# Altium schematic sheet 01_POWER_IO.SchDoc
size 457 x 281 mm; SheetNumber: 1; SheetTotal: 2
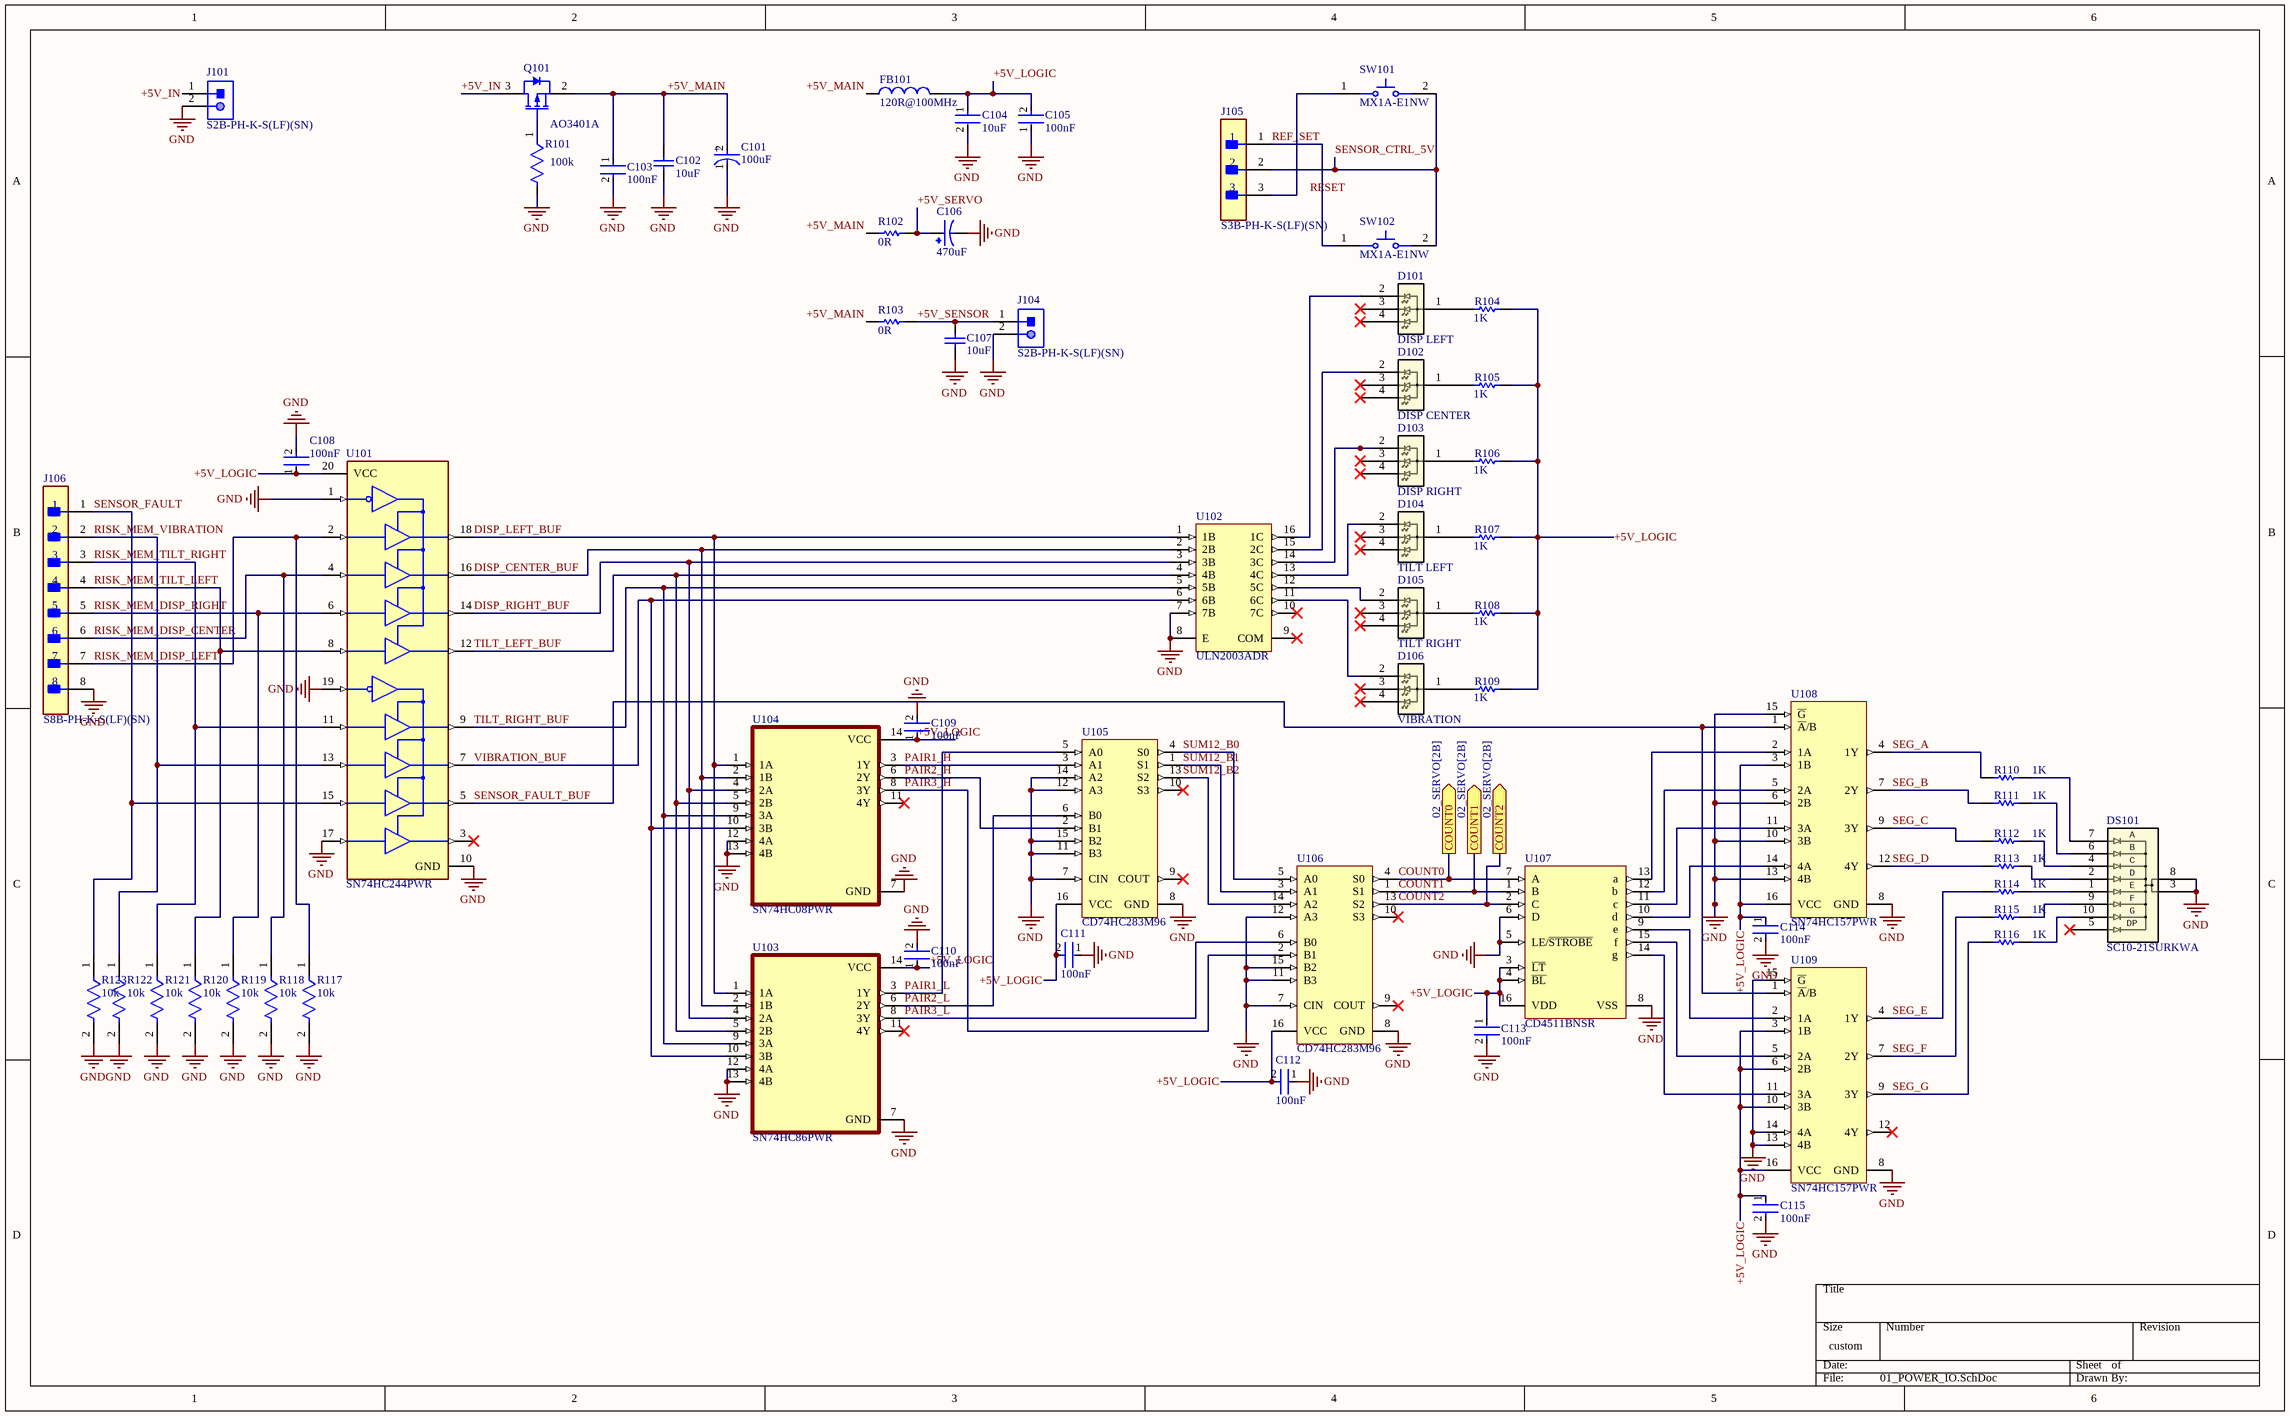
[diagram p0: 01_POWER_IO.SchDoc]

## Parts
C101  100uF  [FP-RAD-TH-D_6_3_0_5-L_11-MFG]
C102  10uF  [CAPC2013X140X45ML15T25]
C103  100nF  [FP-C1608-080-0_1-IPC_B]
C104  10uF  [FP-C2012-125-0_2-MFG]
C105  100nF  [FP-C1608-080-0_1-IPC_B]
C106  470uF  [CAPPRD500W60D1000H1250]
C107  10uF  [CAPC2013X140X45ML15T25]
C108  100nF  [FP-C1608-080-0_1-IPC_B]
C109  100nF  [FP-C1608-080-0_1-IPC_B]
C110  100nF  [FP-C1608-080-0_1-IPC_B]
C111  100nF  [FP-C1608-080-0_1-IPC_B]
C112  100nF  [FP-C1608-080-0_1-IPC_B]
C113  100nF  [FP-C1608-080-0_1-IPC_B]
C114  100nF  [FP-C1608-080-0_1-IPC_B]
C115  100nF  [FP-C1608-080-0_1-IPC_B]
D101  DISP LEFT  [848_ADA]
D102  DISP CENTER  [848_ADA]
D103  DISP RIGHT  [848_ADA]
D104  TILT LEFT  [848_ADA]
D105  TILT RIGHT  [848_ADA]
D106  VIBRATION  [848_ADA]
DS101  SC10-21SURKWA  [SC10-21SURKWA]  (mechanical)
FB101  120R@100MHz  [WE-CBF_0805_L2W1.2H0.9_HC]
J101  S2B-PH-K-S(LF)(SN)  [JST-S2B-PH-K-S_V]
J104  S2B-PH-K-S(LF)(SN)  [JST-S2B-PH-K-S_V]
J105  S3B-PH-K-S(LF)(SN)  [FP-S3B-PH-K-S_LF_SN-MFG]
J106  S8B-PH-K-S(LF)(SN)  [FP-S8B-PH-K-S_LF_SN-MFG]
Q101  AO3401A  [AO-SOT-23-3L_V]
R101  100k  [FP-RC0603-0_55-MFG]
R102  0R  [RESC2013X70X40NL20T20]
R103  0R  [RESC2013X70X40NL20T20]
R104  1K  [RESC1608X55X25NL10T15]
R105  1K  [RESC1608X55X25NL10T15]
R106  1K  [RESC1608X55X25NL10T15]
R107  1K  [RESC1608X55X25NL10T15]
R108  1K  [RESC1608X55X25NL10T15]
R109  1K  [RESC1608X55X25NL10T15]
R110  1K  [RESC1608X55X25NL10T15]
R111  1K  [RESC1608X55X25NL10T15]
R112  1K  [RESC1608X55X25NL10T15]
R113  1K  [RESC1608X55X25NL10T15]
R114  1K  [RESC1608X55X25NL10T15]
R115  1K  [RESC1608X55X25NL10T15]
R116  1K  [RESC1608X55X25NL10T15]
R117  10k  [FP-RC0603-0_55-IPC_C]
R118  10k  [FP-RC0603-0_55-IPC_C]
R119  10k  [FP-RC0603-0_55-IPC_C]
R120  10k  [FP-RC0603-0_55-IPC_C]
R121  10k  [FP-RC0603-0_55-IPC_C]
R122  10k  [FP-RC0603-0_55-IPC_C]
R123  10k  [FP-RC0603-0_55-IPC_C]
SW101  MX1A-E1NW  [MX1A-E1NW]
SW102  MX1A-E1NW  [MX1A-E1NW]
U101  SN74HC244PWR  [FP-PW0020A-MFG]
U102  ULN2003ADR  [D0016A_M]
U103  SN74HC86PWR  [SOP65P640X120-14N]
U104  SN74HC08PWR  [SOP65P640X120-14N]
U105  CD74HC283M96  [D0016A_M]
U106  CD74HC283M96  [D0016A_M]
U107  CD4511BNSR  [NS0016A_L]
U108  SN74HC157PWR  [PW0016A_N]
U109  SN74HC157PWR  [PW0016A_N]

## Ports
COUNT0 (out, see 02_SERVO[2B]), COUNT1 (out, see 02_SERVO[2B]), COUNT2 (out, see 02_SERVO[2B])

## Nets
GND: C101.1(C) C102.1 C103.2 C104.2 C105.1 C106.N C107.1 C108.2 C109.2 C110.2 C111.1 C112.1 C113.2 C114.2 C115.2 DS101.3 DS101.8 J101.2 J104.2 J106.8 R101.2 R117.2 R118.2 R119.2 R120.2 R121.2 R122.2 R123.2 U101.1(1~{OE}) U101.10(GND) U101.17(2A4) U101.19(2~{OE}) U102.7(7B) U102.8(E) U103.7(GND) U103.12(4A) U103.13(4B) U104.7(GND) U104.12(4A) U104.13(4B) U105.7(CIN) U105.8(GND) U105.11(B3) U105.12(A3) U105.14(A2) U105.15(B2) U106.7(CIN) U106.8(GND) U106.11(B3) U106.12(A3) U106.15(B2) U107.5(LE/~{STROBE}) U107.6(D) U107.8(VSS) U108.6(2B) U108.8(GND) U108.10(3B) U108.13(4B) U108.15(~{G}) U109.8(GND) U109.13(4B) U109.14(4A) U109.15(~{G})
+5V_IN: J101.1 Q101.3(DRAIN)
+5V_LOGIC: C104.1 C105.2 C108.1 C109.1 C110.1 C111.2 C112.2 C113.1 C114.1 C115.1 FB101.2 R104.1 R105.1 R106.1 R107.1 R108.1 R109.1 U101.20(VCC) U103.14(VCC) U104.14(VCC) U105.16(VCC) U106.16(VCC) U107.3(~{LT}) U107.4(~{BL}) U107.16(VDD) U108.3(1B) U108.16(VCC) U109.3(1B) U109.6(2B) U109.10(3B) U109.16(VCC)
+5V_MAIN: C101.2(A) C102.2 C103.1 FB101.1 Q101.2(SOURCE) R102.1 R103.1
+5V_SENSOR: C107.2 J104.1 R103.2
+5V_SERVO: C106.P R102.2
COUNT0: U106.4(S0) U107.7(A) ; port COUNT0
COUNT1: U106.1(S1) U107.1(B) ; port COUNT1
COUNT2: U106.13(S2) U107.2(C) ; port COUNT2
DISP_CENTER_BUF: U101.16(1Y2) U102.2(2B) U103.2(1B) U104.2(1B)
DISP_LEFT_BUF: U101.18(1Y1) U102.1(1B) U103.1(1A) U104.1(1A)
DISP_RIGHT_BUF: U101.14(1Y3) U102.3(3B) U103.4(2A) U104.4(2A)
PAIR1_H: U104.3(1Y) U105.3(A1)
PAIR1_L: U103.3(1Y) U105.5(A0)
PAIR2_H: U104.6(2Y) U105.2(B1)
PAIR2_L: U103.6(2Y) U105.6(B0)
PAIR3_H: U104.8(3Y) U106.2(B1)
PAIR3_L: U103.8(3Y) U106.6(B0)
REF_SET: J105.1 SW102.1
RISK_MEM_DISP_CENTER: J106.6 R118.1 U101.4(1A2)
RISK_MEM_DISP_LEFT: J106.7 R117.1 U101.2(1A1)
RISK_MEM_DISP_RIGHT: J106.5 R119.1 U101.6(1A3)
RISK_MEM_TILT_LEFT: J106.4 R120.1 U101.8(1A4)
RISK_MEM_TILT_RIGHT: J106.3 R121.1 U101.11(2A1)
RISK_MEM_VIBRATION: J106.2 R122.1 U101.13(2A2)
SEG_A: R110.2 U108.4(1Y)
SEG_B: R111.2 U108.7(2Y)
SEG_C: R112.2 U108.9(3Y)
SEG_D: R113.2 U108.12(4Y)
SEG_E: R114.2 U109.4(1Y)
SEG_F: R115.2 U109.7(2Y)
SEG_G: R116.2 U109.9(3Y)
SENSOR_CTRL_5V: J105.2 SW101.2 SW102.2
SENSOR_FAULT: J106.1 R123.1 U101.15(2A3)
SENSOR_FAULT_BUF: U101.5(2Y3) U108.1(~{A}/B) U109.1(~{A}/B)
SUM12_B0: U105.4(S0) U106.5(A0)
SUM12_B1: U105.1(S1) U106.3(A1)
SUM12_B2: U105.13(S2) U106.14(A2)
TILT_LEFT_BUF: U101.12(1Y4) U102.4(4B) U103.5(2B) U104.5(2B)
TILT_RIGHT_BUF: U101.9(2Y1) U102.5(5B) U103.9(3A) U104.9(3A)
VIBRATION_BUF: U101.7(2Y2) U102.6(6B) U103.10(3B) U104.10(3B)
NetD101_1: D101.1 R104.2
NetD101_2: D101.2 U102.16(1C)
NetD102_1: D102.1 R105.2
NetD102_2: D102.2 U102.15(2C)
NetD103_1: D103.1 R106.2
NetD103_2: D103.2 U102.14(3C)
NetD104_1: D104.1 R107.2
NetD104_2: D104.2 U102.13(4C)
NetD105_1: D105.1 R108.2
NetD105_2: D105.2 U102.12(5C)
NetD106_1: D106.1 R109.2
NetD106_2: D106.2 U102.11(6C)
NetDS101_1: DS101.1 R114.1
NetDS101_2: DS101.2 R113.1
NetDS101_4: DS101.4 R112.1
NetDS101_6: DS101.6 R111.1
NetDS101_7: DS101.7 R110.1
NetDS101_9: DS101.9 R115.1
NetDS101_10: DS101.10 R116.1
NetJ105_3: J105.3 SW101.1
NetQ101_1: Q101.1(GATE) R101.1
NetU107_9: U107.9(e) U109.2(1A)
NetU107_10: U107.10(d) U108.14(4A)
NetU107_11: U107.11(c) U108.11(3A)
NetU107_12: U107.12(b) U108.5(2A)
NetU107_13: U107.13(a) U108.2(1A)
NetU107_14: U107.14(g) U109.11(3A)
NetU107_15: U107.15(f) U109.5(2A)

Not connected (* = marked no-connect by the designer): D101 3* 4*; D102 3* 4*; D103 3* 4*; D104 3* 4*; D105 3* 4*; D106 3* 4*; DS101 5*; U101 3(2Y4)*; U102 9(COM)* 10(7C)*; U103 11(4Y)*; U104 11(4Y)*; U105 9(COUT)* 10(S3)*; U106 9(COUT)* 10(S3)*; U109 12(4Y)*

## Notes on the sheet
- Labels drawn without touching a wire or pin: RESET
- (in symbol CMP-05427-000141-1) +
- (in symbol SC56-11EWA) A; B; C; D; E; F; G; DP

## Library data of the parts
C101 = CMP-05427-000141-1: Aluminum Electrolytic Capacitors (Radial Lead Type) AEC-Q200 Qualified 100uF ±20% 25V; Lead Diameter: 0.5mm; Life (Hours): 1000Hour; Ripple Current: 130mA; Lead/Base Style: Straight; Construction: RADIAL; Radiation Hardening: No; Packaging: Ammo Pack; Termination: Radial; Mount: Through Hole; Lead Pitch: 2.5mm; Tolerance: 20%; Height - Seated (Max): 0.48inch; Height: 11.2mm; Max Operating Temperature: 105°C; Length: 11.2mm; Diameter: 6.3mm; RoHS Compliant: Yes; Voltage Rating: 25V; Min Operating Temperature: -55°C; Package Quantity: 2000; Capacitance: 100uF; Width: 6.3mm; Voltage Rating (DC): 25V; Series: NHG; Contact Plating: Tin; Case/Package: Radial
C102 C107 = CMP-2007-03370-1: Manufacturer: Murata; Part Number: GRM21BR71A106KE51K
C103 C105 C108-C115 = CMP-2000-04982-2: Multilayer Ceramic Capacitors 100nF ±10% 50V X7R SMD 0603; REACH SVHC: No SVHC; Voltage: 50V; Min Operating Temperature: -55°C; Package Quantity: 1; Case Code (Metric): 1608; Series: C; Termination: SMD/SMT; Length: 1.6mm; Voltage Rating: 50V; Case Code (Imperial): 0603; Number of Pins: 2; RoHS Compliant: Yes; Thickness: 0.037inch; Resistor Type: Ceramic; Radiation Hardening: No; Weight: 7.1E-05oz; Mount: Surface Mount; Capacitance: 100nF; Voltage Rating (DC): 50V; Construction: Flat; Tolerance: 10%; Lead Free: Lead Free; Case/Package: 0603; Max Operating Temperature: 125°C; Height: 0.8mm; Depth: 0.8mm; Packaging: Tape and Reel; Width: 0.031inch; Dielectric Material: Ceramic; Dielectric: X7R
C104 = CMP-2000-05452-2: Multilayer Ceramic Capacitors 10μF ±10% 10V X7R SMD 0805; Series: C; Case/Package: 0805; REACH SVHC: No SVHC; Tolerance: 10%; Resistor Type: Ceramic; Termination: SMD/SMT; Weight: 0.000194oz; Depth: 1.25mm; Capacitance: 10uF; Construction: Flat; RoHS Compliant: Yes; Contact Plating: Tin; Packaging: Tape and Reel; Mount: Surface Mount; Thickness: 0.057inch; Radiation Hardening: No; Dielectric: X7R; Min Operating Temperature: -55°C; Voltage Rating (DC): 10V; Voltage: 10V; Width: 0.049inch; Package Quantity: 1; Number of Pins: 2; Height: 1.25mm; Max Operating Temperature: 125°C; Dielectric Material: Ceramic; Case Code (Imperial): 0805; Lead Free: Lead Free; Voltage Rating: 10V; Case Code (Metric): 2012; Length: 2mm
C106 = ECA1EHG471: Cap Aluminum 470uF 25V 20% (10 X 12.5mm) Radial Aluminum Cylindrical Can 5mm 380mA 2000 hr 105C Bulk; MF: Panasonic; Price: None; Check_prices: https://www.snapeda.com/parts/ECA1EHG471/Panasonic/view-part/5793074/?ref=eda; SnapEDA_Link: https://www.snapeda.com/parts/ECA1EHG471/Panasonic/view-part/5793074/?ref=snap; Purchase-URL: https://pricing.snapeda.com/search/part/ECA1EHG471/?ref=eda; Package: RADIAL-2 Panasonic; Availability: In Stock; MP: ECA1EHG471; Value: *
D101-D106 = 848: Description; Manufacturer_Name: Adafruit Industries; Copyright: Copyright (C) 2026 Ultra Librarian. All rights reserved.; Manufacturer_Part_Number: 848; RefDes: RefDes; Type: Type
DS101 = SC56-11EWA: Description; Manufacturer_Name: Kingbright; Copyright: Copyright (C) 2026 Ultra Librarian. All rights reserved.; Manufacturer_Part_Number: SC56-11EWA; RefDes: RefDes; Type: Type
FB101 = CMP-03913-130924299-1: 742792025 Ferrite Bead, Suppression, 120 Ohm, 5A Rohs Compliant: Yes; Current Rating: 3A; RoHS: Compliant; Min Operating Temperature: -55°C; Max Operating Temperature: 125°C; Length: 2mm; Width: 1.2mm; NexarPartId: 130924299; Height: 900µm
J101 J104 = CMP-1755-00004-1: Male Header, Pitch 2 mm, 1 x 2 Position, Height 4.8 mm, Tail Length 3.4 mm, -25 to 85 degC, RoHS, Bulk; Case\Package: Radial; Tolerance: 20%; Capacitance: 10 uF; Voltage Rating (DC): 50 V; Packaging: Bulk; ComponentLink1URL: http://www.jst-mfg.com/product/pdf/eng/ePH.pdf; Radiation Hardening: No; Height: 11 mm; Package Quantity: 200; PackageDescription: Male Header, Pitch 2 mm, 1 x 2 Position, Height 4.8 mm, Tail Length 3.4 mm; PackageReference: S2B-PH-K-S; Diameter: 5 mm; Pins: 2; Mount: Through Hole; Max Operating Temperature: 85 degC; Min Operating Temperature: -40 degC; ComponentLink1Description: Datasheet; DatasheetVersion: Dec-12; Length: 11 mm; Lead Pitch: 2 mm; REACH SVHC: No SVHC; Voltage Rating: 50 V; RoHSCompliant: true
J105 = CMP-17439-000039-1: CONN HEADER R/A 3POS 2MM; Height: 0.31inch; Weight: 0.0625lb; Length: 0.31inch; Width: 0.31inch
J106 = CMP-17439-000161-1: CONN HEADER R/A 8POS 2MM; Number of Positions: 8; Voltage Rating: 100V; Insulation Resistance: 1GR; Current Rating: 2A; Gender: Male; Contact Resistance: 20mR; Contact Mating Length: 0.13inch; Width: 4.5mm; Contact Finish - Mating: TIN; Insulation Color: Natural; Housing Color: White; Depth: 7.6mm; Min Operating Temperature: -25°C; Lead Pitch: 2mm; Number of Poles: 8; Number of Rows: 1; Height: 9.4mm; REACH SVHC: No SVHC; Contact Type: Male Pin; Length: 17.9mm; Lead Free: Lead Free; Pitch: 2mm; Number of Contacts: 8; Orientation: Right Angle; Flammability Rating: UL94 V-0; Max Operating Temperature: 85°C; Mount: Through Hole; Contact Shape: Square; Termination: Solder; Fastening Type: Detent; Packaging: Bulk; Series: PH; Voltage Rating (AC): 100V; Insulation Material: Nylon; Working Voltage: 100V; Contact Plating: Tin; Housing Material: Polyamide; Connector Type: Header; Number of Pins: 8; Max Voltage Rating (AC): 100V; Max Current Rating: 2A; Contact Material: Brass; Color: White
Q101 = CMP-2000-05778-1: P-Channel MOSFET, 30 V, 4 A, -55 to 150 degC, 3-Pin SOT-23-3L, RoHS, Tape and Reel; Manufacturer: Alpha and Omega; Output Power (Max): NotRequiredW; Power Dissipation: 1.4W; Rad Hardened: No; Drain Efficiency: NotRequired%; Drain-Source On-Volt: 30V; Noise Figure: NotRequireddB; Frequency (Max): NotRequiredMHz; Number of  Elements: 1; Gate-Source Voltage (Max): ?12V; Drain Current (Max): 4A; Channel Mode: Enhancement; Drain-Source On-Res: 0.044ohm; Type: PowerMOSFET; Polarity: P; Package URL: http://www.aosmd.com/res/packaging_information/SOT-23-3L.pdf; Datasheet URL: http://www.aosmd.com/res/data_sheets/AO3401A.pdf; Package Type: SOT-23; Package Description: 3-Pin Small Outline Transistor, Body 2.95 x 1.6 mm, Pitch 0.95 mm; Mounting: SurfaceMount; Manufacturer URL: http://www.aosmd.com/; Continuous Drain Current: 4A; Package Reference: SOT-23-3L; Mounting Technology: SurfaceMount; Operating Temperature Classification: Military; Power Gain: NotRequireddB; Datasheet Version: Rev. 3, 03/2011; Operating Temp Range: -55Cto150C; Pin Count: 3
R101 = CMP-2100-03662-2: RES SMD 100K OHM 1% 1/10W 0603; Voltage Rating (DC): 50V; Resistance: 100kR; Max Power Dissipation: 100mW; Temperature Coefficient: 100ppm/°C; Working Voltage: 75V; Length: 1.6mm; Lead Free: Lead Free; Number of Terminations: 2; Packaging: Tape and Reel; Voltage Rating: 50V; Termination: SMD/SMT; Width: 0.8mm; Resistor Type: Thick Film; Resistance Tolerance: 1%; Features: Moisture Resistant; Height: 0.45mm; Construction: Rectangular; Case/Package: 0603; Military Standard: Not; Case Code (Imperial): 0603; Series: RC; Technology: THICK FILM; Depth: 0.8mm; RoHS Compliant: Yes; REACH SVHC: No SVHC; Min Operating Temperature: -55°C; Case Code (Metric): 1608; Max Operating Temperature: 155°C; Power Rating: 100mW; Number of Pins: 2; Tolerance: 1%
R102 R103 = CMP-1665-00002-5: Chip Resistor, 0 Ohm, +/- 1%, 0.125 W, -55 to 155 degC, 0805 (2012 Metric), RoHS, Tape and Reel; PartNumber: ERJ-6GEY0R00V; Tolerance: 5%; Resistance: 0 Ohm; REACH SVHC: No SVHC; Min Operating Temperature: -55 degC; Case/Package: 0805; Packaging: Tape and Reel; Package Quantity: 5000; ComponentLink1Description: Manufacturer URL; PackageDescription: 2-Pin Surface Mount Device, Body 2 x 1.25 mm; Mounting Technology: Surface Mount; Max Operating Temperature: 155 degC; Width: 1.25 mm; RoHSCompliant: True; Height: 0.6 mm; ComponentLink1URL: http://www.panasonic.com/; ComponentLink2URL: http://industrial.panasonic.com/cdbs/www-data/pdf/RDA0000/AOA0000C84.pdf; Case Code (Imperial): 0805; DatasheetVersion: 03/2015; Length: 2 mm; Case Code (Metric): 2012; ComponentLink2Description: Datasheet; Radiation Hardening: No
R104-R116 = CMP-2000-04205-1: Manufacturer: Yageo; Part Number: RC0603FR-131KL
R117-R123 = CMP-2100-03664-2: RES 10K OHM 1% 1/10W 0603; Voltage Rating: 75V; Voltage Rating (DC): 50V; Resistance: 10kR; Power Rating: 100mW; Temperature Coefficient: 100ppm/°C; Depth: 0.8mm; Termination: SMD/SMT; Resistor Type: Thick Film; Series: RC; Construction: Rectangular; Features: Moisture Resistant; Packaging: Tape and Reel; Min Operating Temperature: -55°C; Number of Terminations: 2; Lead Pitch: 0.3mm; RoHS Compliant: Yes; Case/Package: 0603; Resistance Tolerance: 1%; Military Standard: Not; Weight: 7.1E-05oz; Number of Pins: 2; Tolerance: 1%; Length: 1.6mm; Case Code (Imperial): 0603; Lead Free: Lead Free; Width: 0.8mm; Max Power Dissipation: 100mW; Height: 0.45mm; Max Operating Temperature: 155°C; Case Code (Metric): 1608; Size Code: 0603
SW101 SW102 = MX1A-E1NW: SPST-NO Mechanical Key Switch, 2-Pin; Manufacturer: Omron Electronic Components; Manufacturer: Omron; Manufacturer Part Number: B3U-1000P; IP Rating: IP40; Current Rating: 50mA; Max Contact Resistance: 100mohm; Operating Force: 153gf; Throw Configuration: SPST; Resistance: 0.1Ohm; Max Voltage Rating (DC): 12V; Contact Material: Silver; Max Current Rating: 50mA; Datasheet URL: http://www.omron.com/ecb/products/pdf/en-b3u.pdf; Mounting Technology: SM; Case/Package: B3U-1000; Packaging: TapeandReel; Package Reference: B3U-1000; Manufacturer URL: http://www.omron.com/; Datasheet Version: Jan-15; RoHS Compliant: True; Max Operating Temperature: 70°C; Contact Current Rating: 50mA; Package Quantity: 3500; Package Description: 2-Pin Surface Mount Device, Body 3 x 2.5 mm; Voltage Rating (DC): 12V; Min Operating Temperature: -25°C; Voltage Rating: 12V; Component Type: Switches
U101 = CMP-0440-01258-4: IC BUFFER NON-INVERT 6V 20TSSOP; Operating Supply Voltage: 5V; Low Level Output Current: 7.8mA; Number of Outputs: 8; Polarity: Non-Inverting; Turn-On Delay Time: 250ns; Quiescent Current: 8uA; Number of Bits per Element: 4; Min Supply Voltage: 2V; High Level Output Current: -7.8mA; Number of Elements: 2; Logic Function: Buffer; Package Quantity: 2000; Max Operating Temperature: 85°C; Height: 1.15mm; Number of Pins: 20; Number of Bits: 8; Max Supply Voltage: 6V; Length: 6.5mm; REACH SVHC: No SVHC; Min Operating Temperature: -40°C; Number of Channels: 8; Number of Circuits: 8; Radiation Hardening: No; Number of Output Lines: 8; Mount: Surface Mount; Width: 4.4mm; Packaging: Tape and Reel; Contact Plating: Gold; Lead Free: Lead Free; Number of Input Lines: 8; Case/Package: TSSOP; Number of Inputs: 8; Propagation Delay: 250ns
U102 = CMP-2000-04953-1: High-Voltage, High-Current Darlington Transistor Array, 0.5 A, 50 V, -20 to 70 degC, 16-Pin SOIC (D), Green (RoHS & no Sb/Br), Tape and Reel; Manufacturer: TexasInstruments; Peak DC Collector Current: 0.5A; Package Version: 4040047-6/M, 06/2011; Maximum Collector Emitter Voltage: 50V; Configuration: Array7; Maximum Collector Emitter Saturation Voltage: 1.1@100mA; Rad Hard: No; Packaging: Tape&Reel; Datasheet URL: http://www.ti.com/general/docs/lit/getliterature.tsp?genericPartNumber=uln2003a&fileType=pdf; Package Reference: D16; Category: DarlingtonBJT; Datasheet Version: Rev. O, 01/2016; Manufacturer URL: http://www.ti.com/; Type: NPN; Package Description: 16-Pin Plastic Small Outline, Body 9.9 x 3.9 mm, Pitch 1.27 mm; Mounting: SurfaceMount; Package: 16SOIC; Package URL: http://www.ti.com/lit/ml/mpds178g/mpds178g.pdf
U103 = SN74HC86PWR: 4-ch, 2-input, 2-V to 6-V 5.2 mA drive strength XOR (exclusive OR) gate; MF: Texas Instruments; SnapEDA_Link: https://www.snapeda.com/parts/SN74HC86PWR/Texas+Instruments/view-part/?ref=snap; Package: TSSOP-14 Texas Instruments; Value: *; MP: SN74HC86PWR; Check_prices: https://www.snapeda.com/parts/SN74HC86PWR/Texas+Instruments/view-part/?ref=eda
U104 = SN74HC08PWR: 4-ch, 2-input, 2-V to 6-V 5.2 mA drive strength AND gate; MF: Texas Instruments; SnapEDA_Link: https://www.snapeda.com/parts/SN74HC08PWR/Texas+Instruments/view-part/?ref=snap; Package: TSSOP-14 Texas Instruments; Value: *; MP: SN74HC08PWR; Check_prices: https://www.snapeda.com/parts/SN74HC08PWR/Texas+Instruments/view-part/?ref=eda
U105 U106 = CMP-1623-00106-2: High Speed CMOS Logic 4-Bit Binary Full Adder with Fast Carry, D0016A, LARGE T&R; Manufacturer: Texas Instruments; Voltage(Nom)(V): 3.3,5; Input Type: LVTTL/CMOS; Function: Arithmetic; Schmitt Trigger: No; VCC(Max)(V): 6; tpd @ Nom Voltage(Max)(ns): 42; Output Drive (IOL/IOH)(Max)(mA): 5.2/-5.2; VCC(Min)(V): 2; Inputs: 9; Rating: Catalog; ICC @ Nom Voltage(Max)(mA): 0.08; Bits(#): 4; F @ Nom Voltage(Max)(Mhz): 28; Technology Family: HC; Output Type: CMOS; PackageReference: D0016A; Generic Part Number: CD74HC283; Type: Binary; Operating Temperature Range(C): -55 to 125; Code_JEDEC: MS-012 variation AC; DatasheetVersion: SCHS176D
U107 = CMP-0388-00338-2: CMOS BCD-to-7-Segment LED Latch / Decoder / Driver, 3 to 18 V, -55 to 125 degC, 16-pin SOP (NS16), Green (RoHS & no Sb/Br); Manufacturer: Texas Instruments; Vin(Max)(V): 18; SubFamily: Discrete Segment LED Driver; Rating: Military; Vin(Min)(V): 3; PackageReference: NS0016A; ComponentLink1Description: Manufacturer URL; DatasheetVersion: SCHS072B; PackageVersion: 4040062/C; PackageDescription: 16-Pin Plastic Small Outline, Body 10.20 x 5.30 mm, Pitch 1.27 mm; ComponentLink2URL: http://www.ti.com/general/docs/lit/getliterature.tsp?genericPartNumber=CD4511B&fileType=pdf; Mounting Technology: Surface Mount; ComponentLink3URL: http://www.ti.com/litv/pdf/msop002a; Eco-Plan: Green (RoHS & no Sb/Br); ComponentLink3Description: Package Specification; ComponentLink2Description: Datasheet; ComponentLink1URL: http://www.ti.com/; PartNumber: CD4511BNSR
U108 U109 = CMP-1633-00848-2: Quadruple 2-Line To 1-Line Data Selectors/Multiplexers, PW0016A, LARGE T&R; Manufacturer: Texas Instruments; Output Drive (IOL/IOH)(Max)(mA): 7.8/-7.8; Voltage(Nom)(V): 3.3,5; Technology Family: HC; Input Type: LVTTL/CMOS; tpd @ Nom Voltage(Max)(ns): 32; Schmitt Trigger: No; Channels(#): 4; Rating: Catalog; Bits(#): 2; Output Type: CMOS; Configuration: 2：1; Function: Encoder/Multiplexer; ICC @ Nom Voltage(Max)(mA): 10; VCC(Max)(V): 6; F @ Nom Voltage(Max)(Mhz): 28; DatasheetVersion: SCLS113D; Generic Part Number: SN74HC157; Operating Temperature Range(C): -40 to 85; Type: Standard; PackageReference: PW0016A; VCC(Min)(V): 2; Code_JEDEC: MO-153